# EasyEDA Pro project N01-H6.epro, schematic Schematic1_1, sheets 6 to 7 of 7

## Sheets
6 KEY,DEBUG,LED: Page Name: KEY,DEBUG,LED
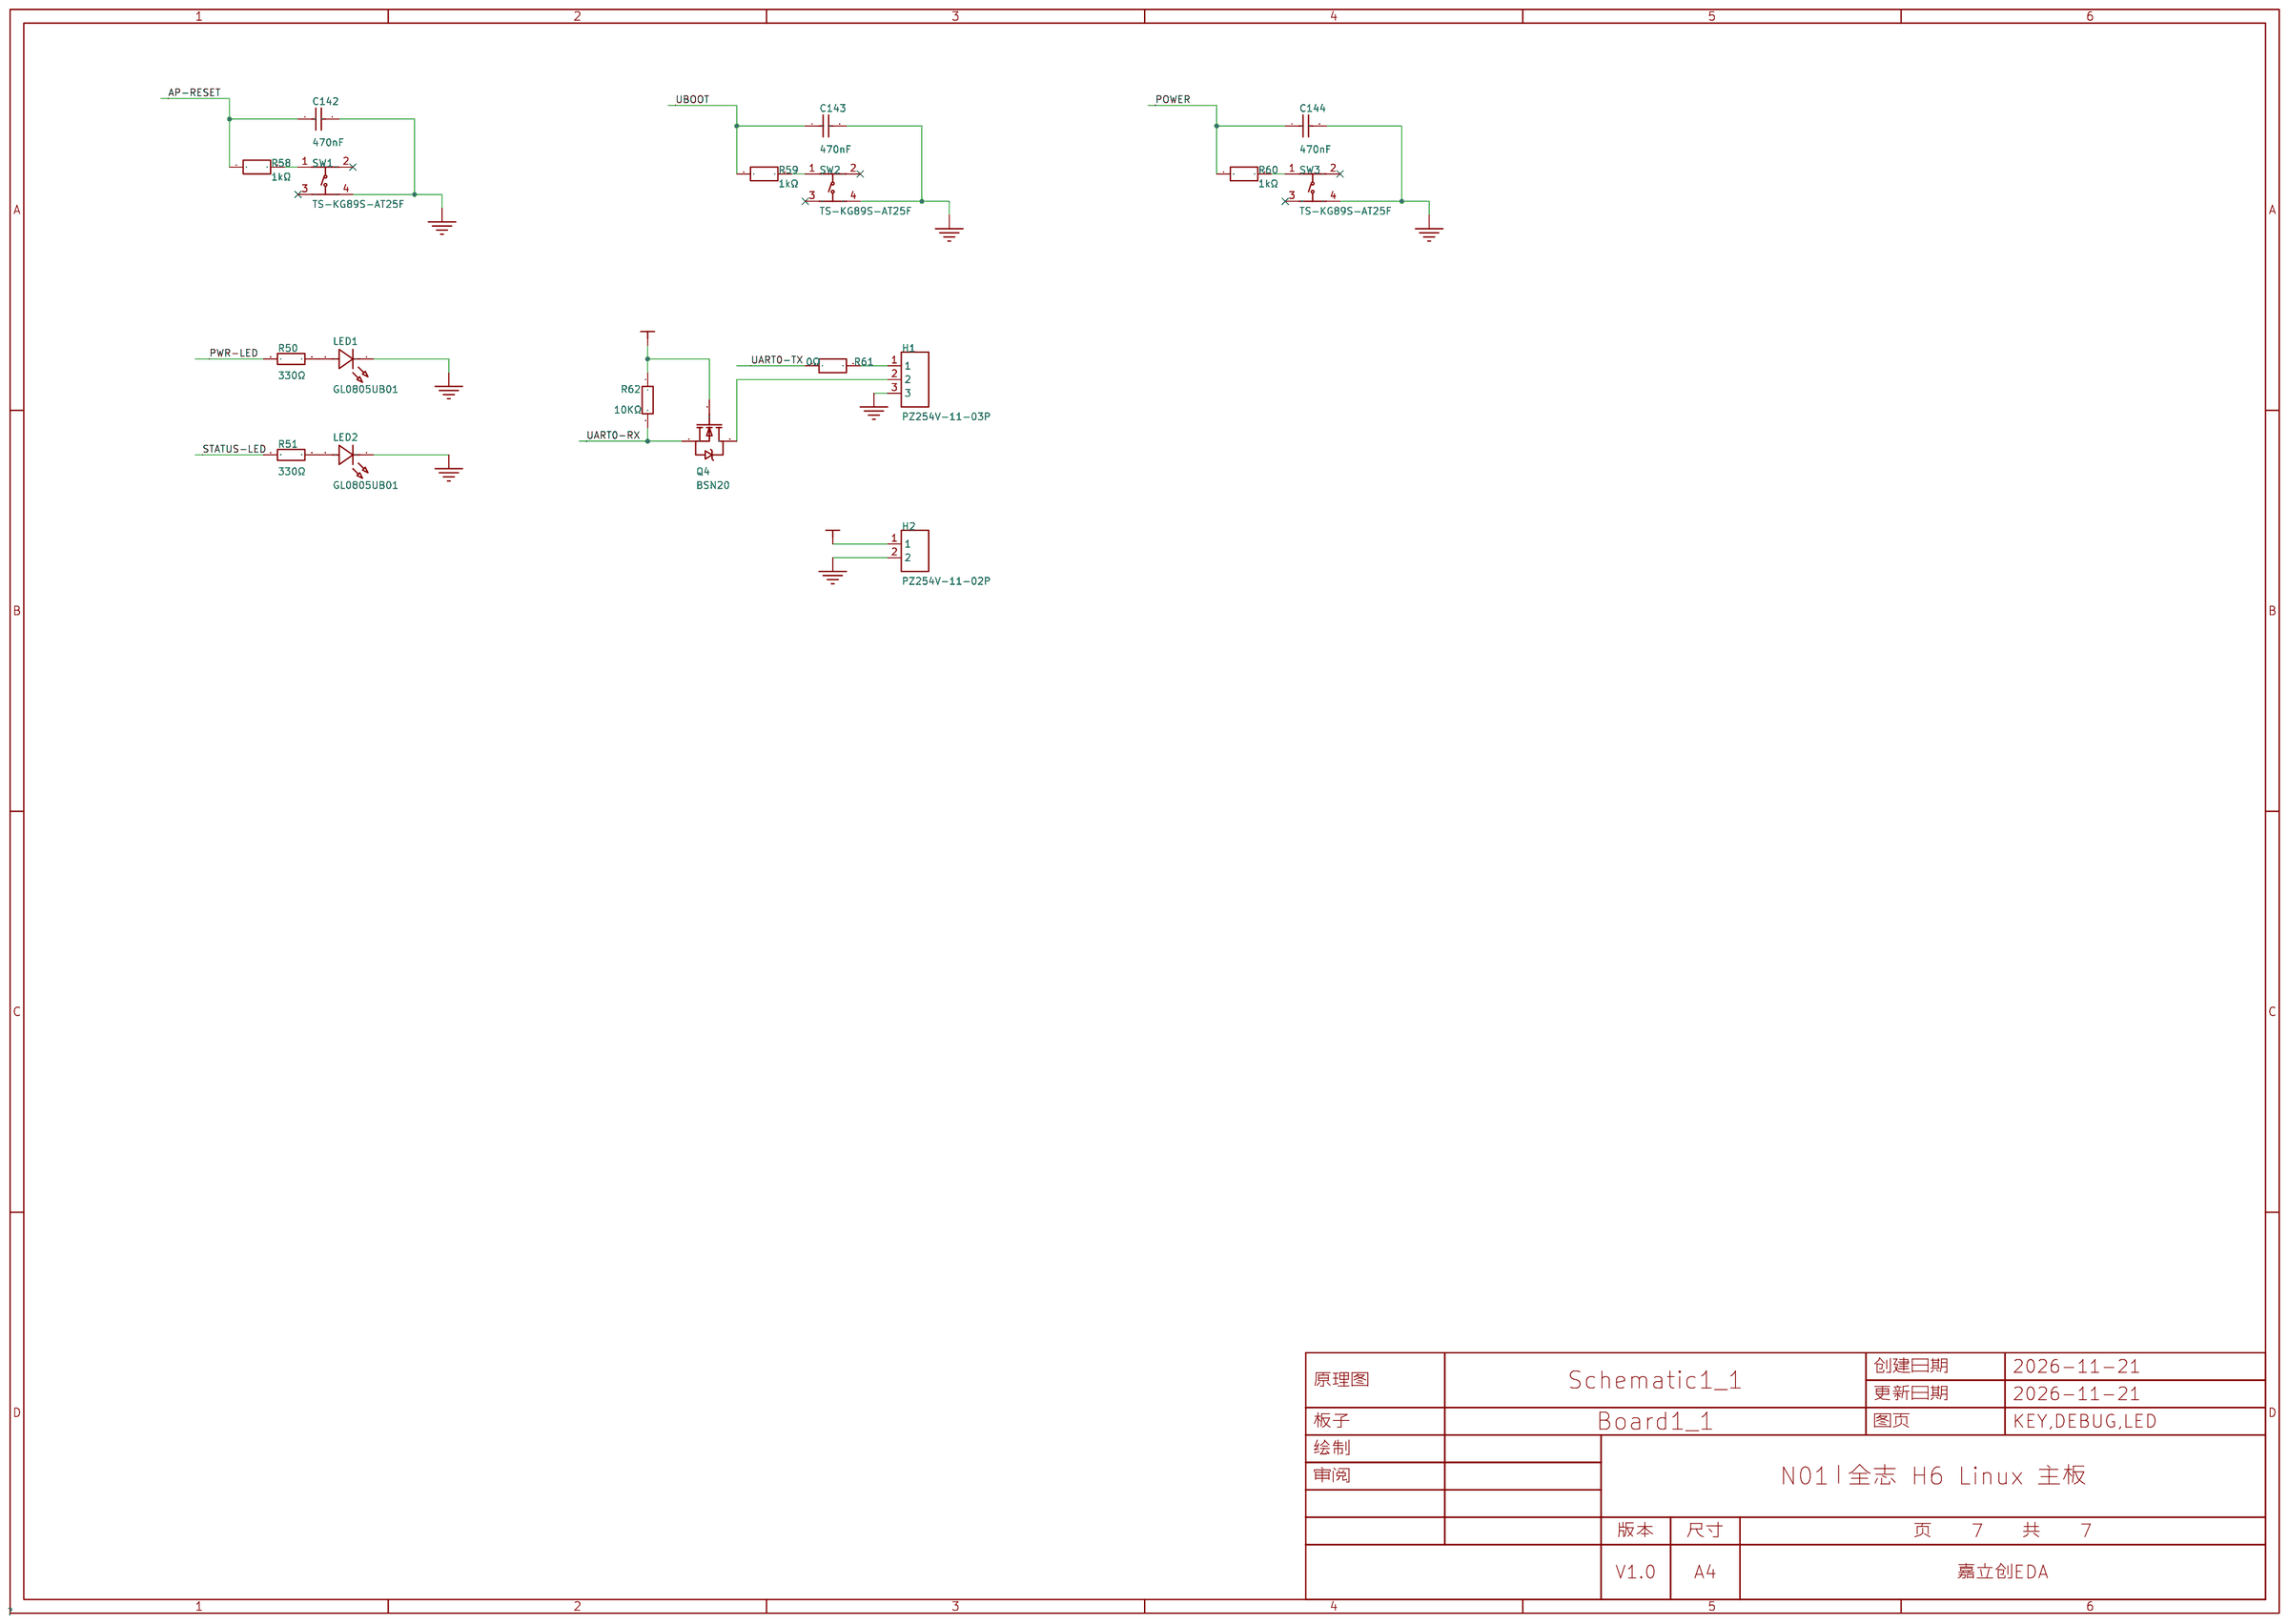
[diagram p5: KEY,DEBUG,LED]
7 SD,USB,CODEC: Page Name: SD,USB,CODEC
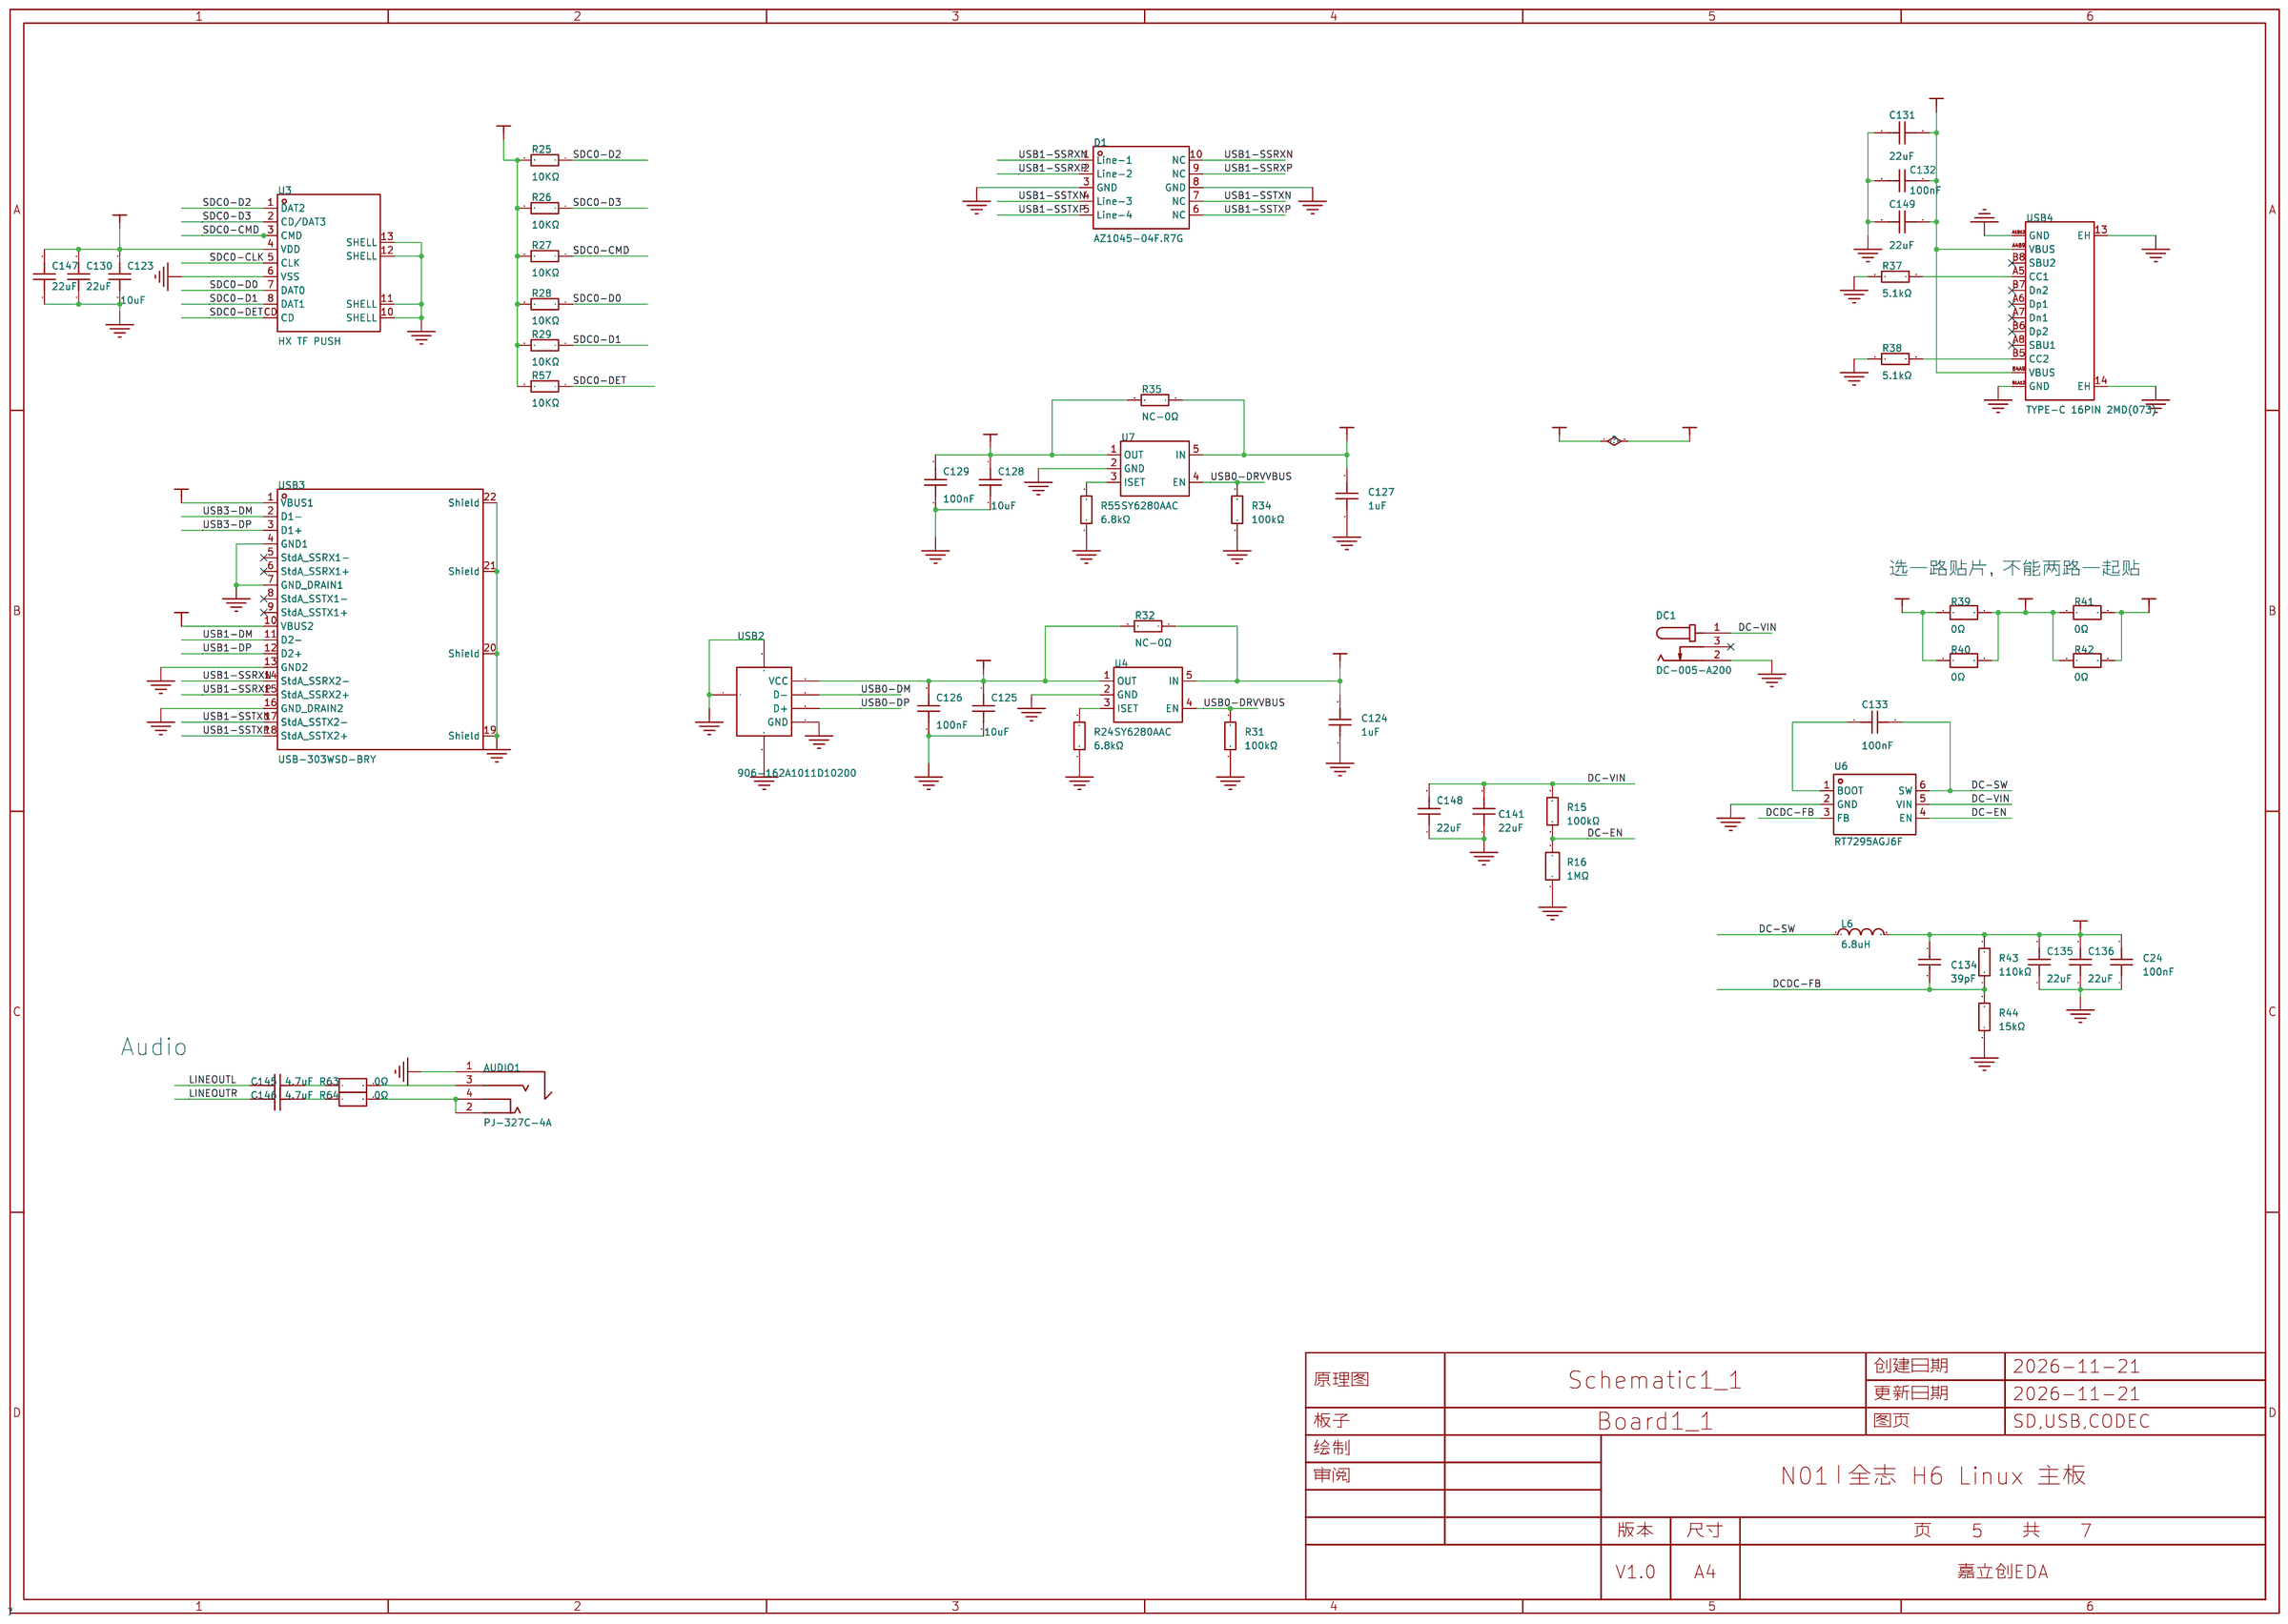
[diagram p6: SD,USB,CODEC]

## Parts
sheet KEY,DEBUG,LED
C142  470nF  [C0603]
C143  470nF  [C0603]
C144  470nF  [C0603]
H1  PZ254V-11-03P  [HDR-TH_3P-P2.54-V-M_PZ254V-11-03P]
H2  PZ254V-11-02P  [HDR-TH_2P-P2.54-V-M]
LED1  GL0805UB01  [LED0805-RD_BLUE]
LED2  GL0805UB01  [LED0805-RD_BLUE]
Q4  BSN20  [SOT-23-3_L2.9-W1.6-P1.90-LS2.8-BR]
R50  330Ω  [R0805]
R51  330Ω  [R0805]
R58  1kΩ  [R0805]
R59  1kΩ  [R0805]
R60  1kΩ  [R0805]
R61  0Ω  [R0805]
R62  10KΩ  [R0805]
SW1  TS-KG89S-AT25F  [SW-SMD_4P-L4.2-W3.3-P2.15-LS5.1]
SW2  TS-KG89S-AT25F  [SW-SMD_4P-L4.2-W3.3-P2.15-LS5.1]
SW3  TS-KG89S-AT25F  [SW-SMD_4P-L4.2-W3.3-P2.15-LS5.1]
sheet SD,USB,CODEC
AUDIO1  PJ-327C-4A  [AUDIO-SMD_PJ-327C-4A]
C24  100nF  [C0603]
C123  10uF  [C0603]
C124  1uF  [C0402]
C125  10uF  [C0603]
C126  100nF  [C0402]
C127  1uF  [C0402]
C128  10uF  [C0603]
C129  100nF  [C0402]
C130  22uF  [C0603]
C131  22uF  [C0603]
C132  100nF  [C0603]
C133  100nF  [C0603]
C134  39pF  [C0603]
C135  22uF  [C0603]
C136  22uF  [C0603]
C141  22uF  [C0603]
C145  4.7uF  [C0402]
C146  4.7uF  [C0402]
C147  22uF  [C0603]
C148  22uF  [C0603]
C149  22uF  [C0603]
D1  AZ1045-04F.R7G  [DFN2510-10_L2.5-W1.0-P0.50-BL]
DC1  DC-005-A200  [DC-IN-TH_DC-005-A200]
L6  6.8uH  [IND-SMD_L7.0-W6.6]
R15  100kΩ  [R0805]
R16  1MΩ  [R0805]
R24  6.8kΩ  [R0805]
R25  10KΩ  [R0805]
R26  10KΩ  [R0805]
R27  10KΩ  [R0805]
R28  10KΩ  [R0805]
R29  10KΩ  [R0805]
R31  100kΩ  [R0805]
R32  NC-0Ω  [R0805]
R34  100kΩ  [R0805]
R35  NC-0Ω  [R0805]
R37  5.1kΩ  [R0805]
R38  5.1kΩ  [R0805]
R39  0Ω  [R0805]
R40  0Ω  [R0805]
R41  0Ω  [R0805]
R42  0Ω  [R0805]
R43  110kΩ  [R0805]
R44  15kΩ  [R0805]
R55  6.8kΩ  [R0805]
R57  10KΩ  [R0805]
R63  0Ω  [R0805]
R64  0Ω  [R0805]
U3  HX TF PUSH  [TF-SMD_TF-PUSH]
U4  SY6280AAC  [SOT-23-5_L3.0-W1.7-P0.95-LS2.8-BL]
U6  RT7295AGJ6F  [SOT-23-6_L2.9-W1.6-P0.95-LS2.8-BR]
U7  SY6280AAC  [SOT-23-5_L3.0-W1.7-P0.95-LS2.8-BL]
USB2  906-162A1011D10200  [USB-A-TH_4P-P1.40-V-F-C39416]
USB3  USB-303WSD-BRY  [USB-A-TH_XUNPU_USB-303WSD-BRY]
USB4  TYPE-C 16PIN 2MD(073)  [USB-C-SMD_TYPE-C-16PIN-2MD-073]

## Library data of the parts
C142-C144 = CL10B474KA8NNNC: 容值:470nF;精度:±10%;额定电压:25V;温度系数:X7R;; LCSC Part Name: 470nF ±10% 25V; Supplier Part: C1623; Manufacturer: SAMSUNG(三星); Supplier Footprint: 0603; JLCPCB Part Class: Basic Part; Datasheet: https://item.szlcsc.com/datasheet/CL10B474KA8NNNC/1975.html; Supplier: LCSC; Tolerance: ±10%; Voltage Rating: 25V; Temperature Coefficient: X7R
H1 = PZ254V-11-03P: 插针结构:1x3P;间距:2.54mm;行距:-;圆针/方针:方针;安装方式:直插;排数:单排;总PIN位数:3P;额定电流:3A;额定电压:250V;配合针长度:6mm;塑高:2.5mm;端接针长度:3mm;触头材质:黄铜;触头镀层:镀金;工作温度:-40℃~+105℃;颜色:黑色;; LCSC Part Name: 1x3P 间距:2.54mm 方针 直插; Supplier Part: C2937625; Manufacturer: XFCN(兴飞); Supplier Footprint: 插件,P=2.54mm; JLCPCB Part Class: Extended Part; Datasheet: https://item.szlcsc.com/datasheet/PZ254V-11-03P/3293280.html; Supplier: LCSC; Pin Structure: 1x3P; Pitch: 2.54mm; Circluar Pins/Square Pins: 方针; Mounting Type: 直插; Number of Rows: 单排; Number of Pins: 3P; Current Rating: 3A; Voltage Rating (Max): 250V; Length of Mating Pin: 6mm; Insulation Height: 2.5mm; Length of End Connection Pin: 3mm; Contact Material: 黄铜; Contact Plating: 镀金; Operating Temperature: -40℃~+105℃; Color: 黑色
H2 = PZ254V-11-02P: 插针结构:1x2P;间距:2.54mm;行距:-;圆针/方针:方针;安装方式:直插;排数:单排;总PIN位数:2P;额定电流:3A;额定电压:250V;配合针长度:6mm;塑高:2.5mm;端接针长度:3mm;触头材质:黄铜;触头镀层:-;工作温度:-40℃~+105℃;颜色:黑色;; LCSC Part Name: 1x2P 间距:2.54mm 方针 直插; Supplier Part: C492401; Manufacturer: XFCN(兴飞); Supplier Footprint: 插件,P=2.54mm; JLCPCB Part Class: Extended Part; Datasheet: https://item.szlcsc.com/datasheet/PZ254V-11-02P/502957.html; Supplier: LCSC; Pin Structure: 1x2P; Pitch: 2.54mm; Circluar Pins/Square Pins: 方针; Mounting Type: 直插; Number of Rows: 单排; Number of Pins: 2P; Current Rating: 3A; Voltage Rating (Max): 250V; Length of Mating Pin: 6mm; Insulation Height: 2.5mm; Length of End Connection Pin: 3mm; Contact Material: 黄铜; Operating Temperature: -40℃~+105℃; Color: 黑色
LED1 LED2 = GL0805UB01: 发光颜色:蓝色;正向压降(Vf):3.1V;正向电流:20mA；5mA;波长:457nm~475nm;二极管配置:独立二极管;透镜颜色:无色透明透镜;发光强度:80mcd;发光角度:120°;载带方式:正贴;工作温度:-40℃~+85℃;; LCSC Part Name: 0805 蓝灯 高亮; Supplier Part: C51933309; Manufacturer: Guiguang light(桂光光电); Supplier Footprint: 0805; JLCPCB Part Class: Extended Part; Datasheet: https://item.szlcsc.com/datasheet/GL0805UB01/54646005.html; Supplier: LCSC; Illumination Color: 蓝色; Voltage - Forward(Vf): 3.1V; Forward Current: 20mA；5mA; Wavelength - Dominant: 457nm~475nm; Diode Configuration: 独立二极管; Lens Color: 无色透明透镜; Luminous Intensity: 80mcd; Viewing Angle: 120°; Mounting Style: 正贴; Operating Temperature: -40℃~+85℃
Q4 = BSN20_C116157: 数量:1个N沟道;漏源电压(Vdss):50V;连续漏极电流(Id):100mA;导通电阻(RDS(on)):10Ω@2.75V,0.2A;耗散功率(Pd):-;阈值电压(Vgs(th)):1.5V@250uA;; LCSC Part Name: 1个N沟道 耐压:50V 电流:0.1A; Supplier Part: C116157; Manufacturer: SHIKUES(时科); Supplier Footprint: SOT-23; JLCPCB Part Class: Extended Part; Datasheet: https://item.szlcsc.com/datasheet/BSN20/117410.html; Supplier: LCSC; Number: 1个N沟道; Drain to Source Voltage: 50V; Current - Continuous Drain(Id): 100mA; RDS(on): 10Ω@2.75V,0.2A; Gate Threshold Voltage (Vgs(th)): 1.5V@250uA; Input Capacitance(Ciss): 40pF; Reverse Transfer Capacitance (Crss@Vds): 10pF; Type: N沟道; Output Capacitance(Coss): 15pF
R50 R51 = 0805W8F3300T5E: 电阻类型:厚膜电阻;阻值:330Ω;精度:±1%;功率:125mW;工作电压:150V;温度系数:±100ppm/℃;; LCSC Part Name: 330Ω ±1% 125mW 厚膜电阻; Supplier Part: C17630; Manufacturer: UNI-ROYAL(厚声); Supplier Footprint: 0805; JLCPCB Part Class: Basic Part; Datasheet: https://item.szlcsc.com/datasheet/0805W8F3300T5E/18318.html; Supplier: LCSC; Type: 厚膜电阻; Tolerance: ±1%; Power(Watts): 125mW; Voltage-Supply(Max): 150V; Temperature Coefficient: ±100ppm/℃; Operating Temperature: -55℃~+155℃
R58-R60 = FRC0805F1001TS: 电阻类型:厚膜电阻;阻值:1kΩ;精度:±1%;功率:125mW;工作电压:150V;温度系数:±100ppm/℃;; LCSC Part Name: 1kΩ ±1% 125mW 厚膜电阻; Supplier Part: C2907232; Manufacturer: FOJAN(富捷); Supplier Footprint: 0805; JLCPCB Part Class: Extended Part; Supplier: LCSC; Type: 厚膜电阻; Tolerance: ±1%; Power(Watts): 125mW; Voltage-Supply(Max): 150V; Temperature Coefficient: ±100ppm/℃; Operating Temperature: -55℃~+155℃
R39-R42 R61 R63 R64 = RE0805FAR000: 电阻类型:合金电阻;阻值:0Ω;精度:±1%;功率:500mW;温度系数:±50ppm/℃;安装方式:贴片;; LCSC Part Name: 0Ω 0.5W 0805 ±1%; Supplier Part: C51934133; Manufacturer: JIERR(捷而瑞); Supplier Footprint: 0805; JLCPCB Part Class: Extended Part; Datasheet: https://item.szlcsc.com/datasheet/RE0805FAR000/54649545.html; Supplier: LCSC; Type: 合金电阻; Tolerance: ±1%; Power(Watts): 500mW; Temperature Coefficient: ±50ppm/℃; Mounting Type: 贴片
R25-R29 R57 R62 = 0805W8F1002T5E_C17414: 电阻类型:厚膜电阻;阻值:10kΩ;精度:±1%;功率:125mW;工作电压:150V;温度系数:±100ppm/℃;; LCSC Part Name: 10kΩ ±1% 125mW 厚膜电阻; Supplier Part: C17414; Manufacturer: UNI-ROYAL(厚声); Manufacturer Part: 0805W8F1002T5E; Supplier Footprint: 0805; JLCPCB Part Class: Basic Part; Datasheet: https://item.szlcsc.com/datasheet/0805W8F1002T5E/18102.html; Supplier: LCSC; Type: 厚膜电阻; Tolerance: ±1%; Power(Watts): 125mW; Voltage-Supply(Max): 150V; Temperature Coefficient: ±100ppm/℃; Operating Temperature: -55℃~+155℃
SW1-SW3 = TS-KG89S-AT25F: 电路结构:单刀单掷;按钮形状:椭圆形按钮;作用力:250gf;安装方式:立贴;开关长度:4.2mm;开关宽度:3.25mm;开关高度:2.5mm;带支架:不带;触点电流:50mA;额定电压(DC):12V;绝缘电阻:100MΩ;机械寿命:10万次;; LCSC Part Name: 4.2*3.25*2.5mm 立贴 轻触开关; Supplier Part: C2874599; Manufacturer: HANBO(汉博); Supplier Footprint: SMD; JLCPCB Part Class: Extended Part; Datasheet: https://atta.szlcsc.com/upload/public/pdf/source/20221110/0D75E68DCC1CEC2670E8A2B9A9134A65.pdf; Supplier: LCSC; Circuit: 单刀单掷; Actuator Style: 椭圆形按钮; Operating Force: 250gf; Mounting Style: 立贴; Switch Length: 4.2mm; Switch Width: 3.25mm; Switch Height: 2.5mm; Strike Gundam: 不带; Contact Current: 50mA; Voltage Rating (DC): 12V; Insulation Resistance: 100MΩ; Actuator/Cap Color: 白色; Pin Style: SMD接片; Mechanical Life: 10万次
AUDIO1 = PJ-327C-4A: 连接器类型:3.5mm耳机座;额定电流:500mA;额定电压:30V;触头材质:磷青铜;触头镀层:银;; LCSC Part Name: 3.5mm耳机座; Supplier Part: C145813; Manufacturer: 韩国韩荣; Supplier Footprint: SMD; JLCPCB Part Class: Extended Part; Datasheet: https://item.szlcsc.com/datasheet/PJ-327C-4A/157145.html; Supplier: LCSC; Connector Type: 3.5mm耳机座; Current Rating: 500mA; Voltage Rating (Max): 30V; Contact Material: 磷青铜; Contact Plating: 银
C24 C133 = FCC0603B104K500CT: 容值:100nF;精度:±10%;额定电压:50V;温度系数:X7R;; LCSC Part Name: 100nF ±10% 50V; Supplier Part: C5137636; Manufacturer: FOJAN(富捷); Supplier Footprint: 0603; JLCPCB Part Class: Extended Part; Datasheet: https://item.szlcsc.com/datasheet/FCC0603B104K500CT/5747088.html; Supplier: LCSC; Tolerance: ±10%; Voltage Rating: 50V; Temperature Coefficient: X7R
C123 C125 C128 = CL10A106KP8NNNC: 容值:10uF;精度:±10%;额定电压:10V;温度系数:X5R;; LCSC Part Name: 10uF ±10% 10V; Supplier Part: C19702; Manufacturer: SAMSUNG(三星); Supplier Footprint: 0603; JLCPCB Part Class: Basic Part; Datasheet: https://item.szlcsc.com/datasheet/CL10A106KP8NNNC/20411.html; Supplier: LCSC; Tolerance: ±10%; Voltage Rating: 10V; Temperature Coefficient: X5R
C124 C127 = HGC0402R5105K500NTEJ: 容值:1uF;精度:±10%;额定电压:50V;温度系数:X5R;; LCSC Part Name: 1uF ±10% 50V; Supplier Part: C7472948; Manufacturer: Chinocera(华瓷); Supplier Footprint: 0402; JLCPCB Part Class: Extended Part; Datasheet: https://item.szlcsc.com/datasheet/HGC0402R5105K500NTEJ/8532795.html; Supplier: LCSC; Tolerance: ±10%; Voltage Rating: 50V; Temperature Coefficient: X5R
C126 C129 = CL05B104KO5NNNC: 容值:100nF;精度:±10%;额定电压:16V;温度系数:X7R;; LCSC Part Name: 100nF ±10% 16V; Supplier Part: C1525; Manufacturer: SAMSUNG(三星); Supplier Footprint: 0402; JLCPCB Part Class: Basic Part; Datasheet: https://item.szlcsc.com/datasheet/CL05B104KO5NNNC/1877.html; Supplier: LCSC; Tolerance: ±10%; Voltage Rating: 16V; Temperature Coefficient: X7R
C130 C135 C136 C141 C147-C149 = HGC0603R5226M100NTHJ: 容值:22uF;精度:±20%;额定电压:10V;温度系数:X5R;; LCSC Part Name: 22uF ±20% 10V; Supplier Part: C7432770; Manufacturer: Chinocera(华瓷); Supplier Footprint: 0603; JLCPCB Part Class: Extended Part; Datasheet: https://item.szlcsc.com/datasheet/HGC0603R5226M100NTHJ/8438252.html; Supplier: LCSC; Tolerance: ±20%; Voltage Rating: 10V; Temperature Coefficient: X5R
C131 = CGA0603X5R226M160JT: 容值:22uF;精度:±20%;额定电压:16V;温度系数:X5R;; LCSC Part Name: 22uF ±20% 16V; Supplier Part: C6119868; Manufacturer: HRE(芯声); Supplier Footprint: 0603; JLCPCB Part Class: Extended Part; Datasheet: https://item.szlcsc.com/datasheet/CGA0603X5R226M160JT/7062574.html; Supplier: LCSC; Tolerance: ±20%; Voltage Rating: 16V; Temperature Coefficient: X5R
C132 = CGA0603X7R104K500JT: 容值:100nF;精度:±10%;额定电压:50V;温度系数:X7R;; LCSC Part Name: 100nF ±10% 50V; Supplier Part: C6119867; Manufacturer: HRE(芯声); Supplier Footprint: 0603; JLCPCB Part Class: Extended Part; Datasheet: https://item.szlcsc.com/datasheet/CGA0603X7R104K500JT/7062573.html; Supplier: LCSC; Tolerance: ±10%; Voltage Rating: 50V; Temperature Coefficient: X7R
C134 = CC0603JRNPO9BN390: 容值:39pF;精度:±5%;额定电压:50V;温度系数:NP0;; LCSC Part Name: 39pF ±5% 50V; Supplier Part: C107049; Manufacturer: YAGEO(国巨); Supplier Footprint: 0603; JLCPCB Part Class: Extended Part; Datasheet: https://item.szlcsc.com/datasheet/CC0603JRNPO9BN390/108265.html; Supplier: LCSC; Tolerance: ±5%; Voltage Rating: 50V; Temperature Coefficient: NP0
C145 C146 = CL05A475KP5NRNC: 容值:4.7uF;精度:±10%;额定电压:10V;温度系数:X5R;; LCSC Part Name: 4.7uF ±10% 10V; Supplier Part: C368809; Manufacturer: SAMSUNG(三星); Supplier Footprint: 0402; JLCPCB Part Class: Extended Part; Datasheet: https://item.szlcsc.com/datasheet/CL05A475KP5NRNC/342854.html; Supplier: LCSC; Tolerance: ±10%; Voltage Rating: 10V; Temperature Coefficient: X5R
D1 = AZ1045-04F.R7G: 反向截止电压(Vrwm):5V;钳位电压:12V;峰值脉冲电流(Ipp):3.5A@8/20us;峰值脉冲功率(Ppp):30W@8/20us;击穿电压:6V;; LCSC Part Name: ESD 5V截止 峰值脉冲电流：3.5A@8/20us; Supplier Part: C356811; Manufacturer: AMAZING(晶焱); Supplier Footprint: DFN2510-10; JLCPCB Part Class: Extended Part; Datasheet: https://item.szlcsc.com/datasheet/AZ1045-04F.R7G/331915.html; Supplier: LCSC; Reverse Stand-Off Voltage (Vrwm): 5V; Clamping Voltage: 12V; Peak Pulse Current (Ipp): 3.5A@8/20us; Peak Pulse Power Dissipation (Ppp): 30W@8/20us; Voltage - Breakdown: 6V; Reverse Leakage Current (Ir): 1.5uA; Number of Channels: 四路; level of protection: IEC 61000-4-5；IEC 61000-4-2; Type: ESD; Junction Capacitance: 0.5pF
DC1 = DC-005-A200: 连接器类型:DC电源插座;安装方式:弯插;触点内径:2mm;触点外径:6.4mm;额定电流:3A;额定电压:30V;工作温度:-20℃~+70℃;; LCSC Part Name: DC电源插座 内径:2mm 外径:6.4mm; Supplier Part: C720557; Manufacturer: XUNPU(讯普); Supplier Footprint: 插件; JLCPCB Part Class: Extended Part; Datasheet: https://item.szlcsc.com/datasheet/DC-005-A200/763564.html; Supplier: LCSC; Connector Type: DC电源插座; Mounting Type: 弯插; Inside Contact Diameter: 2mm; Outside Contact Diameter: 6.4mm; Current Rating: 3A; Voltage Rating (Max): 30V; Operating Temperature: -20℃~+70℃
L6 = FXL0630-6R8-M: 电感值:6.8uH;精度:±20%;额定电流:5A;饱和电流(Isat):6A;类型:一体成型电感;; LCSC Part Name: 6.8uH ±20% 6A; Supplier Part: C167221; Manufacturer: cjiang(长江微电); Supplier Footprint: SMD,7x6.6mm; JLCPCB Part Class: Extended Part; Datasheet: https://item.szlcsc.com/datasheet/FXL0630-6R8-M/178604.html; Supplier: LCSC; Tolerance: ±20%; Current Rating: 5A; Current - Saturation(Isat): 6A; DC Resistance(DCR): 48mΩ; Type: 一体成型电感
R15 R31 R32 R34 R35 = 0805W8F1003T5E: 电阻类型:厚膜电阻;阻值:100kΩ;精度:±1%;功率:125mW;工作电压:150V;温度系数:±100ppm/℃;; LCSC Part Name: 100kΩ ±1% 125mW 厚膜电阻; Supplier Part: C149504; Manufacturer: UNI-ROYAL(厚声); Supplier Footprint: 0805; JLCPCB Part Class: Basic Part; Datasheet: https://item.szlcsc.com/datasheet/0805W8F1003T5E/160838.html; Supplier: LCSC; Type: 厚膜电阻; Tolerance: ±1%; Power(Watts): 125mW; Voltage-Supply(Max): 150V; Temperature Coefficient: ±100ppm/℃; Operating Temperature: -55℃~+155℃
R16 = AS051MF: 阻值:1MΩ;精度:±1%;功率:125mW;工作电压:150V;温度系数:±100ppm/℃;; LCSC Part Name: 1M ±1%; Supplier Part: C49330244; Manufacturer: HKR(香港电阻); Supplier Footprint: 0805; JLCPCB Part Class: Extended Part; Datasheet: https://item.szlcsc.com/datasheet/AS051MF/51812008.html; Supplier: LCSC; Tolerance: ±1%; Power(Watts): 125mW; Voltage-Supply(Max): 150V; Temperature Coefficient: ±100ppm/℃; Operating Temperature: -55℃~+155℃
R24 R55 = 0805W8F6801T5E: 电阻类型:厚膜电阻;阻值:6.8kΩ;精度:±1%;功率:125mW;工作电压:150V;温度系数:±100ppm/℃;; LCSC Part Name: 6.8kΩ ±1% 125mW 厚膜电阻; Supplier Part: C17772; Manufacturer: UNI-ROYAL(厚声); Supplier Footprint: 0805; JLCPCB Part Class: Basic Part; Datasheet: https://item.szlcsc.com/datasheet/0805W8F6801T5E/18460.html; Supplier: LCSC; Type: 厚膜电阻; Tolerance: ±1%; Power(Watts): 125mW; Voltage-Supply(Max): 150V; Temperature Coefficient: ±100ppm/℃; Operating Temperature: -55℃~+155℃
R37 R38 = 0805W8F5101T5E: 电阻类型:厚膜电阻;阻值:5.1kΩ;精度:±1%;功率:125mW;工作电压:150V;温度系数:±100ppm/℃;; LCSC Part Name: 5.1kΩ ±1% 125mW 厚膜电阻; Supplier Part: C27834; Manufacturer: UNI-ROYAL(厚声); Supplier Footprint: 0805; JLCPCB Part Class: Basic Part; Datasheet: https://item.szlcsc.com/datasheet/0805W8F5101T5E/28584.html; Supplier: LCSC; Type: 厚膜电阻; Tolerance: ±1%; Power(Watts): 125mW; Voltage-Supply(Max): 150V; Temperature Coefficient: ±100ppm/℃; Operating Temperature: -55℃~+155℃
R43 = 0805W8F1103T5E: 电阻类型:厚膜电阻;阻值:110kΩ;精度:±1%;功率:125mW;工作电压:150V;温度系数:±100ppm/℃;; LCSC Part Name: 110kΩ ±1% 125mW 厚膜电阻; Supplier Part: C17422; Manufacturer: UNI-ROYAL(厚声); Supplier Footprint: 0805; JLCPCB Part Class: Extended Part; Datasheet: https://item.szlcsc.com/datasheet/0805W8F1103T5E/18110.html; Supplier: LCSC; Type: 厚膜电阻; Tolerance: ±1%; Power(Watts): 125mW; Voltage-Supply(Max): 150V; Temperature Coefficient: ±100ppm/℃; Operating Temperature: -55℃~+155℃
R44 = 0805W8F1502T5E: 电阻类型:厚膜电阻;阻值:15kΩ;精度:±1%;功率:125mW;工作电压:150V;温度系数:±100ppm/℃;; LCSC Part Name: 15kΩ ±1% 125mW 厚膜电阻; Supplier Part: C17475; Manufacturer: UNI-ROYAL(厚声); Supplier Footprint: 0805; JLCPCB Part Class: Basic Part; Datasheet: https://item.szlcsc.com/datasheet/0805W8F1502T5E/18163.html; Supplier: LCSC; Type: 厚膜电阻; Tolerance: ±1%; Power(Watts): 125mW; Voltage-Supply(Max): 150V; Temperature Coefficient: ±100ppm/℃; Operating Temperature: -55℃~+155℃
U3 = HX TF PUSH: 卡连接方式:自弹式;卡类型:MicroSD卡(TF卡);连接器类型:卡座;本体最大高度:2mm;工作温度:-20℃~+70℃;; LCSC Part Name: 自弹式 MicroSD卡(TF卡) 卡座; Supplier Part: C5184837; Manufacturer: hanxia(韩下); Supplier Footprint: SMD; JLCPCB Part Class: Extended Part; Datasheet: https://item.szlcsc.com/datasheet/HX%2520TF%2520PUSH/5851216.html; Supplier: LCSC; Card Connection Mode: 自弹式; Card Type: MicroSD卡(TF卡); Connector Type: 卡座; Additional Card Detection Pins: 有; Height Above Board: 2mm; Operating Temperature: -20℃~+70℃; Rated Voltage (Max): 5V
U4 U7 = SY6280AAC_C55136: 类型:高侧开关;通道数:1;输入控制逻辑:高电平有效;工作电压:2.4V~5.5V;最大连续电流:2A;导通电阻:80mΩ;; LCSC Part Name: 低损耗功率分配开关; Supplier Part: C55136; Manufacturer: Silergy(矽力杰); Supplier Footprint: SOT-23-5; JLCPCB Part Class: Extended Part; Datasheet: https://item.szlcsc.com/datasheet/SY6280AAC/56162.html; Supplier: LCSC; Type: 高侧开关; Number of Channels: 1; Control Input Logic: 高电平有效; Voltage - Supply: 2.4V~5.5V; Maximum Continuous Current: 2A; RDS(on): 80mΩ; Features: 短路保护；过流保护；反向电流阻断；输出放电功能；过温保护; Operating Temperature	-: -40℃~+125℃
U6 = RT7295AGJ6F: 功能类型:降压型;工作电压:4.3V~18V;输出电压:600mV~8V;输出电流:3.5A;输出类型:可调;; LCSC Part Name: 降压型 3.5A 4.3V~18V; Supplier Part: C130800; Manufacturer: RICHTEK(立锜); Supplier Footprint: SOT-23-6; JLCPCB Part Class: Extended Part; Datasheet: https://item.szlcsc.com/datasheet/RT7295AGJ6F/142089.html; Supplier: LCSC; Function: 降压型; Voltage - Supply: 4.3V~18V; Output Voltage: 600mV~8V; Output Current: 3.5A; Frequency - Switching: 500kHz; Operating Temperature: -40℃~+125℃; Synchronous Rectifier: 是; Number of Outputs: 1; Topology: 降压式; Quiescent Current: 500uA; Switch tube (built-in/external): 内置; Output Type: 可调; Features: 轻载高效模式；逐波限流；过流保护；输出放电；打嗝限流
USB2 = 906-162A1011D10200: 连接器类型:Type-A;协议标准:USB 2.0;公母:母;安装方式:侧插;触点数量:4P;端口数量:1;额定电流 - 电源:2A;工作温度:-;; LCSC Part Name: Type-A 母 侧插; Supplier Part: C39417; Manufacturer: 精拓金; Supplier Footprint: 插件; JLCPCB Part Class: Extended Part; Datasheet: https://item.szlcsc.com/datasheet/906-162A1011D10200/40400.html; Supplier: LCSC; Connector Type: Type-A; Protocol Standard: USB 2.0; Gender: 母; Mounting Type: 侧插; Number of Contacts: 4P; Number of Ports: 1; Current Rating-Power: 2A; Voltage Rating: 30V; Connect-Disconnect Life: 1.5千次; Length: 14mm
USB3 = USB-303WSD-BRY: 连接器类型:Type-A;协议标准:USB 3.0;公母:母;安装方式:弯插;触点数量:9Px2;端口数量:2;额定电流 - 电源:1.8A;工作温度:-30℃~+85℃;; LCSC Part Name: Type-A 母 弯插; Supplier Part: C2895028; Manufacturer: XUNPU(讯普); Supplier Footprint: 弯插; JLCPCB Part Class: Extended Part; Datasheet: https://item.szlcsc.com/datasheet/USB-303WSD-BRY/3132965.html; Supplier: LCSC; Connector Type: Type-A; Protocol Standard: USB 3.0; Gender: 母; Mounting Type: 弯插; Number of Contacts: 9Px2; Number of Ports: 2; Current Rating-Power: 1.8A; Voltage Rating: 30V; Detection color: 蓝色; Operating Temperature: -30℃~+85℃
USB4 = TYPE-C 16PIN 2MD(073): 连接器类型:Type-C;协议标准:-;公母:母;安装方式:卧贴;触点数量:16P;端口数量:1;额定电流 - 电源:3A;工作温度:-25℃~+85℃;; LCSC Part Name: Type-C 母 卧贴; Supplier Part: C2765186; Manufacturer: SHOU HAN(首韩); Supplier Footprint: SMD; JLCPCB Part Class: Extended Part; Datasheet: https://item.szlcsc.com/datasheet/TYPE-C%252016PIN%25202MD(073)/2901843.html; Supplier: LCSC; Connector Type: Type-C; Gender: 母; Mounting Type: 卧贴; Number of Contacts: 16P; Number of Ports: 1; Current Rating-Power: 3A; Voltage Rating: 5V; Connect-Disconnect Life: 1万次; Detection color: 黑色; Operating Temperature: -25℃~+85℃

## Nets
GND: AUDIO1.1 C24.1 C123.2 C124.1 C125.2 C126.1 C127.1 C128.2 C129.1 C130.1 C131.1 C132.2 C135.1 C136.1 C141.1 C142.2 C143.2 C144.2 C147.1 C148.1 C149.2 D1.3(GND) D1.8(GND) DC1.2 H1.3 H2.2 LED1.1(K) LED2.1(K) R16.1 R24.1 R31.1 R34.1 R37.1 R38.1 R44.1 R55.1 SW1.4 SW2.4 SW3.4 U3.6(VSS) U3.10(SHELL) U3.11(SHELL) U3.12(SHELL) U3.13(SHELL) U4.2(GND) U6.2(GND) U7.2(GND) USB2.4(GND) USB2.5 USB2.6 USB2.7 USB3.4(GND1) USB3.7(GND_DRAIN1) USB3.13(GND2) USB3.16(GND_DRAIN2) USB3.19(Shield) USB3.20(Shield) USB3.21(Shield) USB3.22(Shield) USB4.13(EH) USB4.14(EH) USB4.A1B12(GND) USB4.B1A12(GND) ; also on sheet 1 2 3 5
AP-RESET: C142.1 R58.1 ; also on sheet 3 5
CLDO1: C123.1 C130.2 C147.2 R25.2 R26.2 R27.2 R28.2 R29.2 R57.2 U3.4(VDD) ; also on sheet 2 3 4 5
CLDO2: Q4.1(G) R62.1 ; also on sheet 3 4 5
DC-5V: C24.2 C134.1 C135.2 C136.2 L6.2 R41.2 R42.2 R43.2
DC-EN: R15.1 R16.2 U6.4(EN)
DC-SW: C133.2 L6.1 U6.6(SW)
DC-VIN: C141.2 C148.2 DC1.1 R15.2 U6.5(VIN)
DCDC-FB: C134.2 R43.1 R44.2 U6.3(FB)
LINEOUTL: C145.2 ; also on sheet 5
LINEOUTR: C146.2 ; also on sheet 5
POWER: C144.1 R60.1 ; also on sheet 3
PWR-LED: R50.1 ; also on sheet 4
SDC0-CLK: U3.5(CLK) ; also on sheet 4
SDC0-CMD: R27.1 U3.3(CMD) ; also on sheet 4
SDC0-D0: R28.1 U3.7(DAT0) ; also on sheet 4
SDC0-D1: R29.1 U3.8(DAT1) ; also on sheet 4
SDC0-D2: R25.1 U3.1(DAT2) ; also on sheet 4
SDC0-D3: R26.1 U3.2(CD/DAT3) ; also on sheet 4
SDC0-DET: R57.1 U3.CD ; also on sheet 4
STATUS-LED: R51.1 ; also on sheet 4
TYPE-5V: C131.2 C132.1 C149.1 R39.1 R40.1 USB4.A4B9(VBUS) USB4.B4A9(VBUS)
UART0-RX: Q4.2(S) R62.2 ; also on sheet 4
UART0-TX: R61.1 ; also on sheet 4
UBOOT: C143.1 R59.1 ; also on sheet 5
USB0-DM: USB2.2(D-) ; also on sheet 5
USB0-DP: USB2.3(D+) ; also on sheet 5
USB0-DRVVBUS: R31.2 R34.2 U4.4(EN) U7.4(EN) ; also on sheet 4
USB1-DM: USB3.11(D2-) ; also on sheet 5
USB1-DP: USB3.12(D2+) ; also on sheet 5
USB1-SSRXN: D1.1(Line-1) D1.10(NC) USB3.14(StdA_SSRX2-) ; also on sheet 5
USB1-SSRXP: D1.2(Line-2) D1.9(NC) USB3.15(StdA_SSRX2+) ; also on sheet 5
USB1-SSTXN: D1.4(Line-3) D1.7(NC) USB3.17(StdA_SSTX2-) ; also on sheet 5
USB1-SSTXP: D1.5(Line-4) D1.6(NC) USB3.18(StdA_SSTX2+) ; also on sheet 5
USB3-DM: USB3.2(D1-) ; also on sheet 5
USB3-DP: USB3.3(D1+) ; also on sheet 5
USB-5V: C124.2 C127.2 H2.1 R32.1 R35.1 R39.2 R40.2 R41.1 R42.1 U4.5(IN) U7.5(IN) ; also on sheet 2 3
USB-VBUS1: C125.1 C126.2 R32.2 U4.1(OUT) USB2.1(VCC)
USB-VBUS2: C128.1 C129.2 R35.2 U7.1(OUT) USB3.1(VBUS1) USB3.10(VBUS2)
$8N79: R58.2 SW1.1
$8N84: R59.2 SW2.1
$8N87: R60.2 SW3.1
$8N99: H1.1 R61.2
$8N102: H1.2 Q4.3(D)
$8N104: LED1.2(A) R50.2
$8N105: LED2.2(A) R51.2
$9N31: R24.2 U4.3(ISET)
$9N44: R55.2 U7.3(ISET)
$9N87: R38.2 USB4.B5(CC2)
$9N88: R37.2 USB4.A5(CC1)
$9N98: C133.1 U6.1(BOOT)
$9N120: C146.1 R64.1
$9N121: C145.1 R63.1
$9N123: AUDIO1.3 R63.2
$9N124: AUDIO1.2 AUDIO1.4 R64.2

Not connected (* = marked no-connect by the designer): DC1 3*; SW1 2* 3*; SW2 2* 3*; SW3 2* 3*; USB3 5(StdA_SSRX1-)* 6(StdA_SSRX1+)* 8(StdA_SSTX1-)* 9(StdA_SSTX1+)*; USB4 A6(Dp1)* A7(Dn1)* A8(SBU1)* B6(Dp2)* B7(Dn2)* B8(SBU2)*

## Notes on the sheets
sheet 7
- 选一路贴片，不能两路一起贴
- Audio
